# Altium schematic sheet Top-Sheet.SchDoc
size A4; SheetNumber: 1; SheetTotal: 9
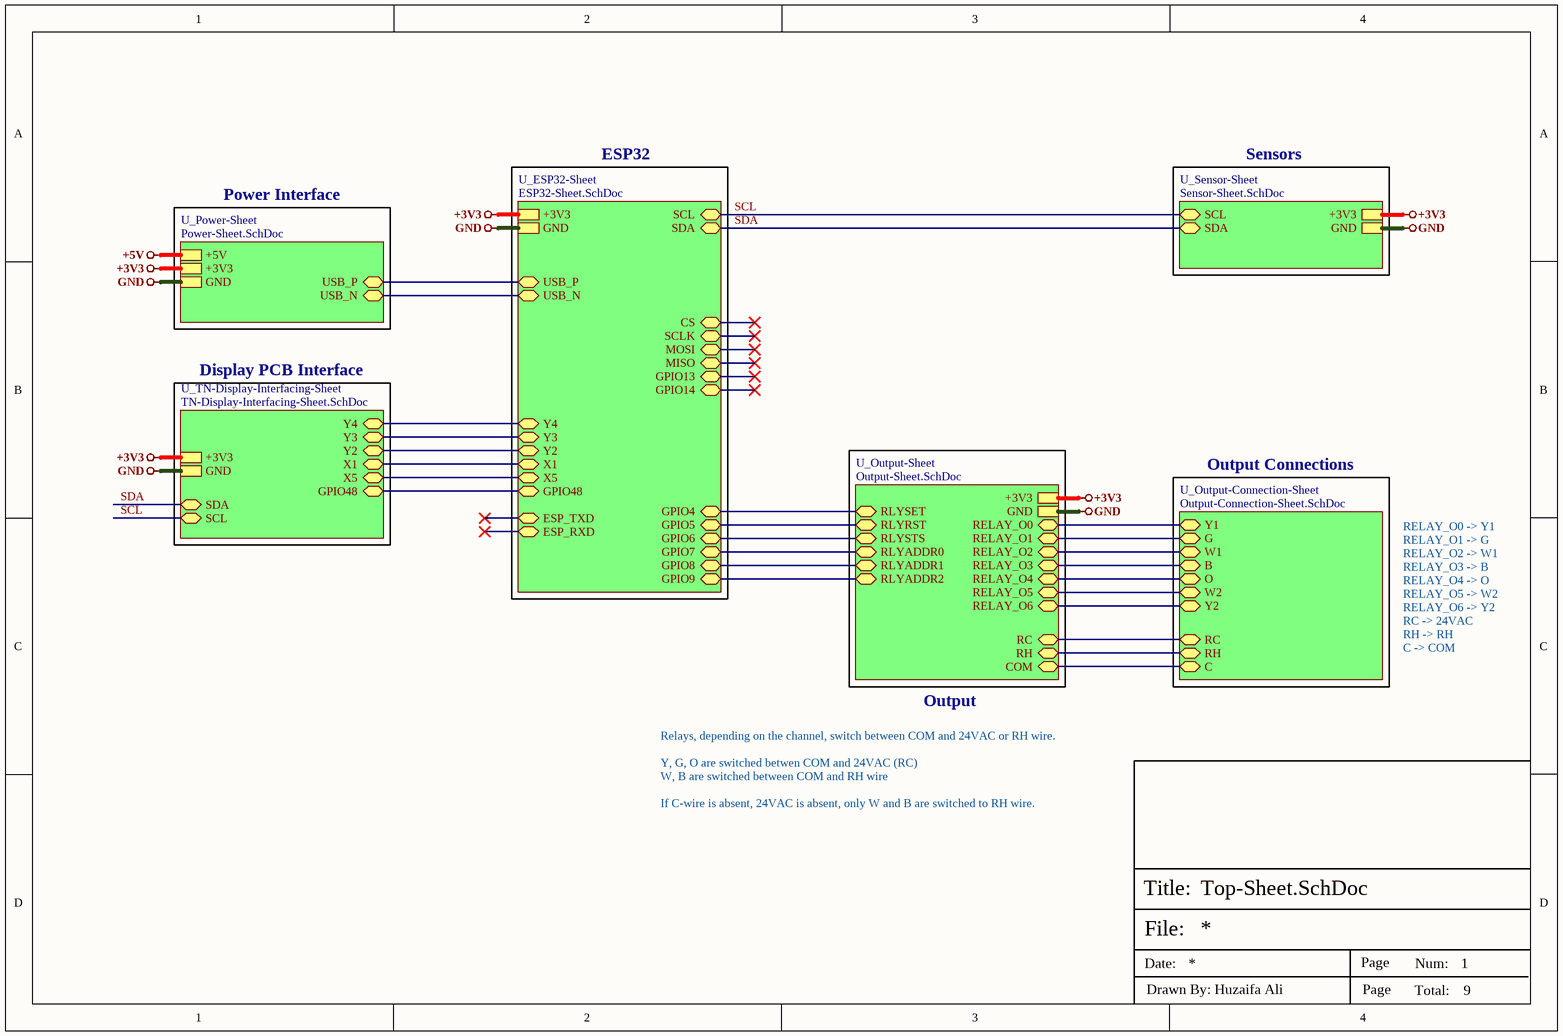
[diagram p0: Top-Sheet.SchDoc]

## Sub-sheets
U_ESP32-Sheet = ESP32-Sheet.SchDoc: +3V3, GND, USB_P (bidir), USB_N (bidir), ESP_TXD (bidir), ESP_RXD (bidir), SCL (bidir), SDA (bidir), CS (bidir), SCLK (bidir), MOSI (bidir), MISO (bidir), GPIO13 (bidir), GPIO14 (bidir), GPIO4 (bidir), GPIO5 (bidir), GPIO6 (bidir), GPIO7 (bidir), GPIO8 (bidir), GPIO9 (bidir), Y4 (bidir), Y3 (bidir), Y2 (bidir), X1 (bidir), X5 (bidir), GPIO48 (bidir)
U_Output-Connection-Sheet = Output-Connection-Sheet.SchDoc: Y1 (bidir), G (bidir), W1 (bidir), RC (bidir), RH (bidir), B (bidir), O (bidir), W2 (bidir), Y2 (bidir), C (bidir)
U_Output-Sheet = Output-Sheet.SchDoc: +3V3, GND, RLYSET (bidir), RLYRST (bidir), RLYSTS (bidir), RLYADDR0 (bidir), RLYADDR1 (bidir), RLYADDR2 (bidir), RELAY_O0 (bidir), RELAY_O1 (bidir), RELAY_O2 (bidir), RELAY_O3 (bidir), RELAY_O4 (bidir), RELAY_O5 (bidir), RELAY_O6 (bidir), RC (bidir), RH (bidir), COM (bidir)
U_Power-Sheet = Power-Sheet.SchDoc: +5V, +3V3, GND, USB_P (bidir), USB_N (bidir)
U_Sensor-Sheet = Sensor-Sheet.SchDoc: +3V3, GND, SDA (bidir), SCL (bidir)
U_TN-Display-Interfacing-Sheet = TN-Display-Interfacing-Sheet.SchDoc: +3V3, GND, Y4 (bidir), Y3 (bidir), Y2 (bidir), X1 (bidir), X5 (bidir), GPIO48 (bidir), SDA (bidir), SCL (bidir)

## Nets
+3V3: sheet U_Output-Sheet/+3V3, sheet U_ESP32-Sheet/+3V3, sheet U_Sensor-Sheet/+3V3, sheet U_Power-Sheet/+3V3, sheet U_TN-Display-Interfacing-Sheet/+3V3
+5V: sheet U_Power-Sheet/+5V
GND: sheet U_Output-Sheet/GND, sheet U_ESP32-Sheet/GND, sheet U_Sensor-Sheet/GND, sheet U_Power-Sheet/GND, sheet U_TN-Display-Interfacing-Sheet/GND
SCL: sheet U_ESP32-Sheet/SCL, sheet U_Sensor-Sheet/SCL, sheet U_TN-Display-Interfacing-Sheet/SCL
SDA: sheet U_ESP32-Sheet/SDA, sheet U_Sensor-Sheet/SDA, sheet U_TN-Display-Interfacing-Sheet/SDA
(unnamed): sheet U_Output-Sheet/RLYSET, sheet U_ESP32-Sheet/GPIO4
(unnamed): sheet U_Output-Sheet/RLYRST, sheet U_ESP32-Sheet/GPIO5
(unnamed): sheet U_Output-Sheet/RLYSTS, sheet U_ESP32-Sheet/GPIO6
(unnamed): sheet U_Output-Sheet/RLYADDR0, sheet U_ESP32-Sheet/GPIO7
(unnamed): sheet U_Output-Sheet/RLYADDR1, sheet U_ESP32-Sheet/GPIO8
(unnamed): sheet U_Output-Sheet/RLYADDR2, sheet U_ESP32-Sheet/GPIO9
(unnamed): sheet U_Output-Sheet/RELAY_O0, sheet U_Output-Connection-Sheet/Y1
(unnamed): sheet U_Output-Sheet/RELAY_O1, sheet U_Output-Connection-Sheet/G
(unnamed): sheet U_Output-Sheet/RELAY_O2, sheet U_Output-Connection-Sheet/W1
(unnamed): sheet U_Output-Sheet/RELAY_O3, sheet U_Output-Connection-Sheet/B
(unnamed): sheet U_Output-Sheet/RELAY_O4, sheet U_Output-Connection-Sheet/O
(unnamed): sheet U_Output-Sheet/RELAY_O5, sheet U_Output-Connection-Sheet/W2
(unnamed): sheet U_Output-Sheet/RELAY_O6, sheet U_Output-Connection-Sheet/Y2
(unnamed): sheet U_Output-Sheet/RC, sheet U_Output-Connection-Sheet/RC
(unnamed): sheet U_Output-Sheet/RH, sheet U_Output-Connection-Sheet/RH
(unnamed): sheet U_Output-Sheet/COM, sheet U_Output-Connection-Sheet/C
(unnamed): sheet U_ESP32-Sheet/USB_P, sheet U_Power-Sheet/USB_P
(unnamed): sheet U_ESP32-Sheet/USB_N, sheet U_Power-Sheet/USB_N
(unnamed): sheet U_ESP32-Sheet/Y4, sheet U_TN-Display-Interfacing-Sheet/Y4
(unnamed): sheet U_ESP32-Sheet/Y3, sheet U_TN-Display-Interfacing-Sheet/Y3
(unnamed): sheet U_ESP32-Sheet/Y2, sheet U_TN-Display-Interfacing-Sheet/Y2
(unnamed): sheet U_ESP32-Sheet/X1, sheet U_TN-Display-Interfacing-Sheet/X1
(unnamed): sheet U_ESP32-Sheet/X5, sheet U_TN-Display-Interfacing-Sheet/X5
(unnamed): sheet U_ESP32-Sheet/GPIO48, sheet U_TN-Display-Interfacing-Sheet/GPIO48

## Notes on the sheet
- ESP32
- Sensors
- Power Interface
- Display PCB Interface
- Output Connections
- RELAY_O0 -> Y1
  RELAY_O1 -> G
  RELAY_O2 -> W1
  RELAY_O3 -> B
  RELAY_O4 -> O
  RELAY_O5 -> W2
  RELAY_O6 -> Y2
  RC -> 24VAC
  RH -> RH
  C -> COM
- Output
- Relays, depending on the channel, switch between COM and 24VAC or RH wire.
  Y, G, O are switched betwen COM and 24VAC (RC)
  W, B are switched between COM and RH wire
  If C-wire is absent, 24VAC is absent, only W and B are switched to RH wire.
- File:
- Title:
- Date:
- Page
- Num:
- Total:
- Drawn By: Huzaifa Ali